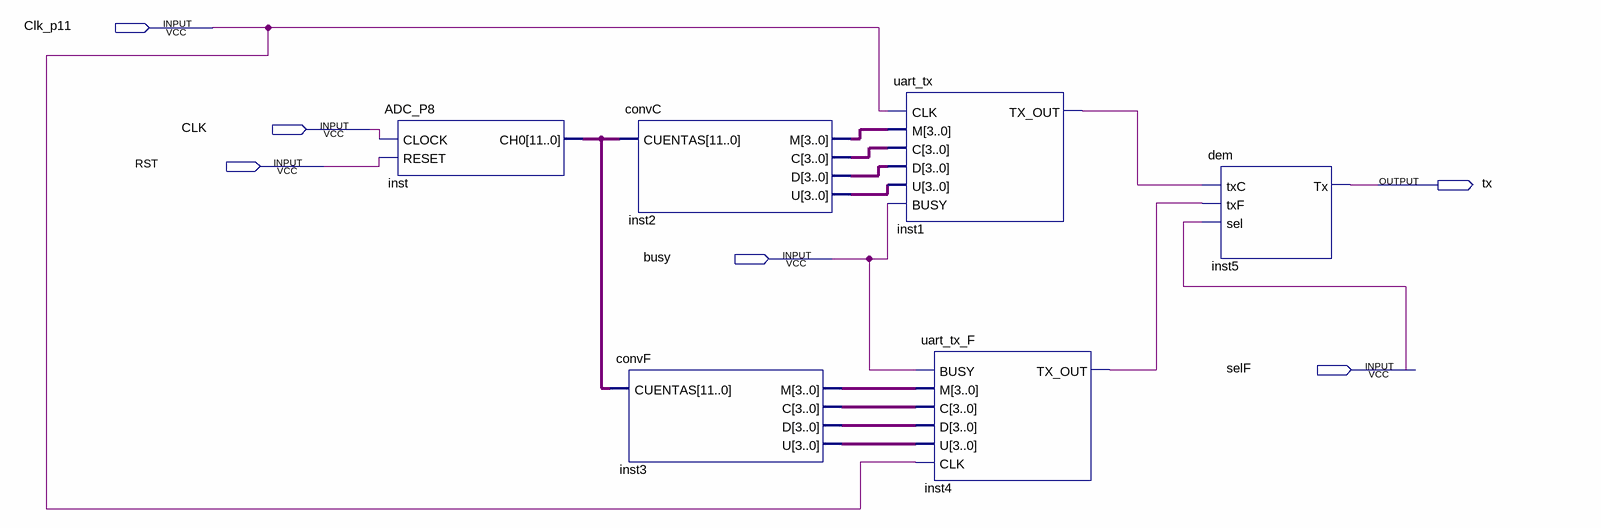
[diagram p0: schematic sheet]
// Quartus schematic pr.bdf as structural Verilog: 6 symbols, 6 pins
module pr (
  input  Clk_p11,
  input  CLK,
  input  RST,
  input  busy,
  input  selF,
  output tx
);

  wire inst1_tx_out, inst4_tx_out;
  wire [3:0] inst2_c, inst2_d, inst2_m, inst2_u, inst3_c, inst3_d, inst3_m, inst3_u;
  wire [11:0] inst_ch0;

  ADC_P8 inst (.CLOCK(CLK), .RESET(RST), .CH0(inst_ch0));
  convF inst3 (.CUENTAS(inst_ch0), .M(inst3_m), .C(inst3_c), .D(inst3_d), .U(inst3_u));
  convC inst2 (.CUENTAS(inst_ch0), .M(inst2_m), .C(inst2_c), .D(inst2_d), .U(inst2_u));
  uart_tx inst1 (.CLK(Clk_p11), .M(inst2_m), .C(inst2_c), .D(inst2_d), .U(inst2_u), .BUSY(busy), .TX_OUT(inst1_tx_out));
  uart_tx_F inst4 (
    .BUSY(busy), .M(inst3_m), .C(inst3_c), .D(inst3_d), .U(inst3_u), .CLK(Clk_p11), .TX_OUT(inst4_tx_out));
  dem inst5 (.txC(inst1_tx_out), .txF(inst4_tx_out), .sel(selF), .Tx(tx));
endmodule
